# Altium project EVLSERVO1_control_v2.PrjPcb (part 3 of 9)
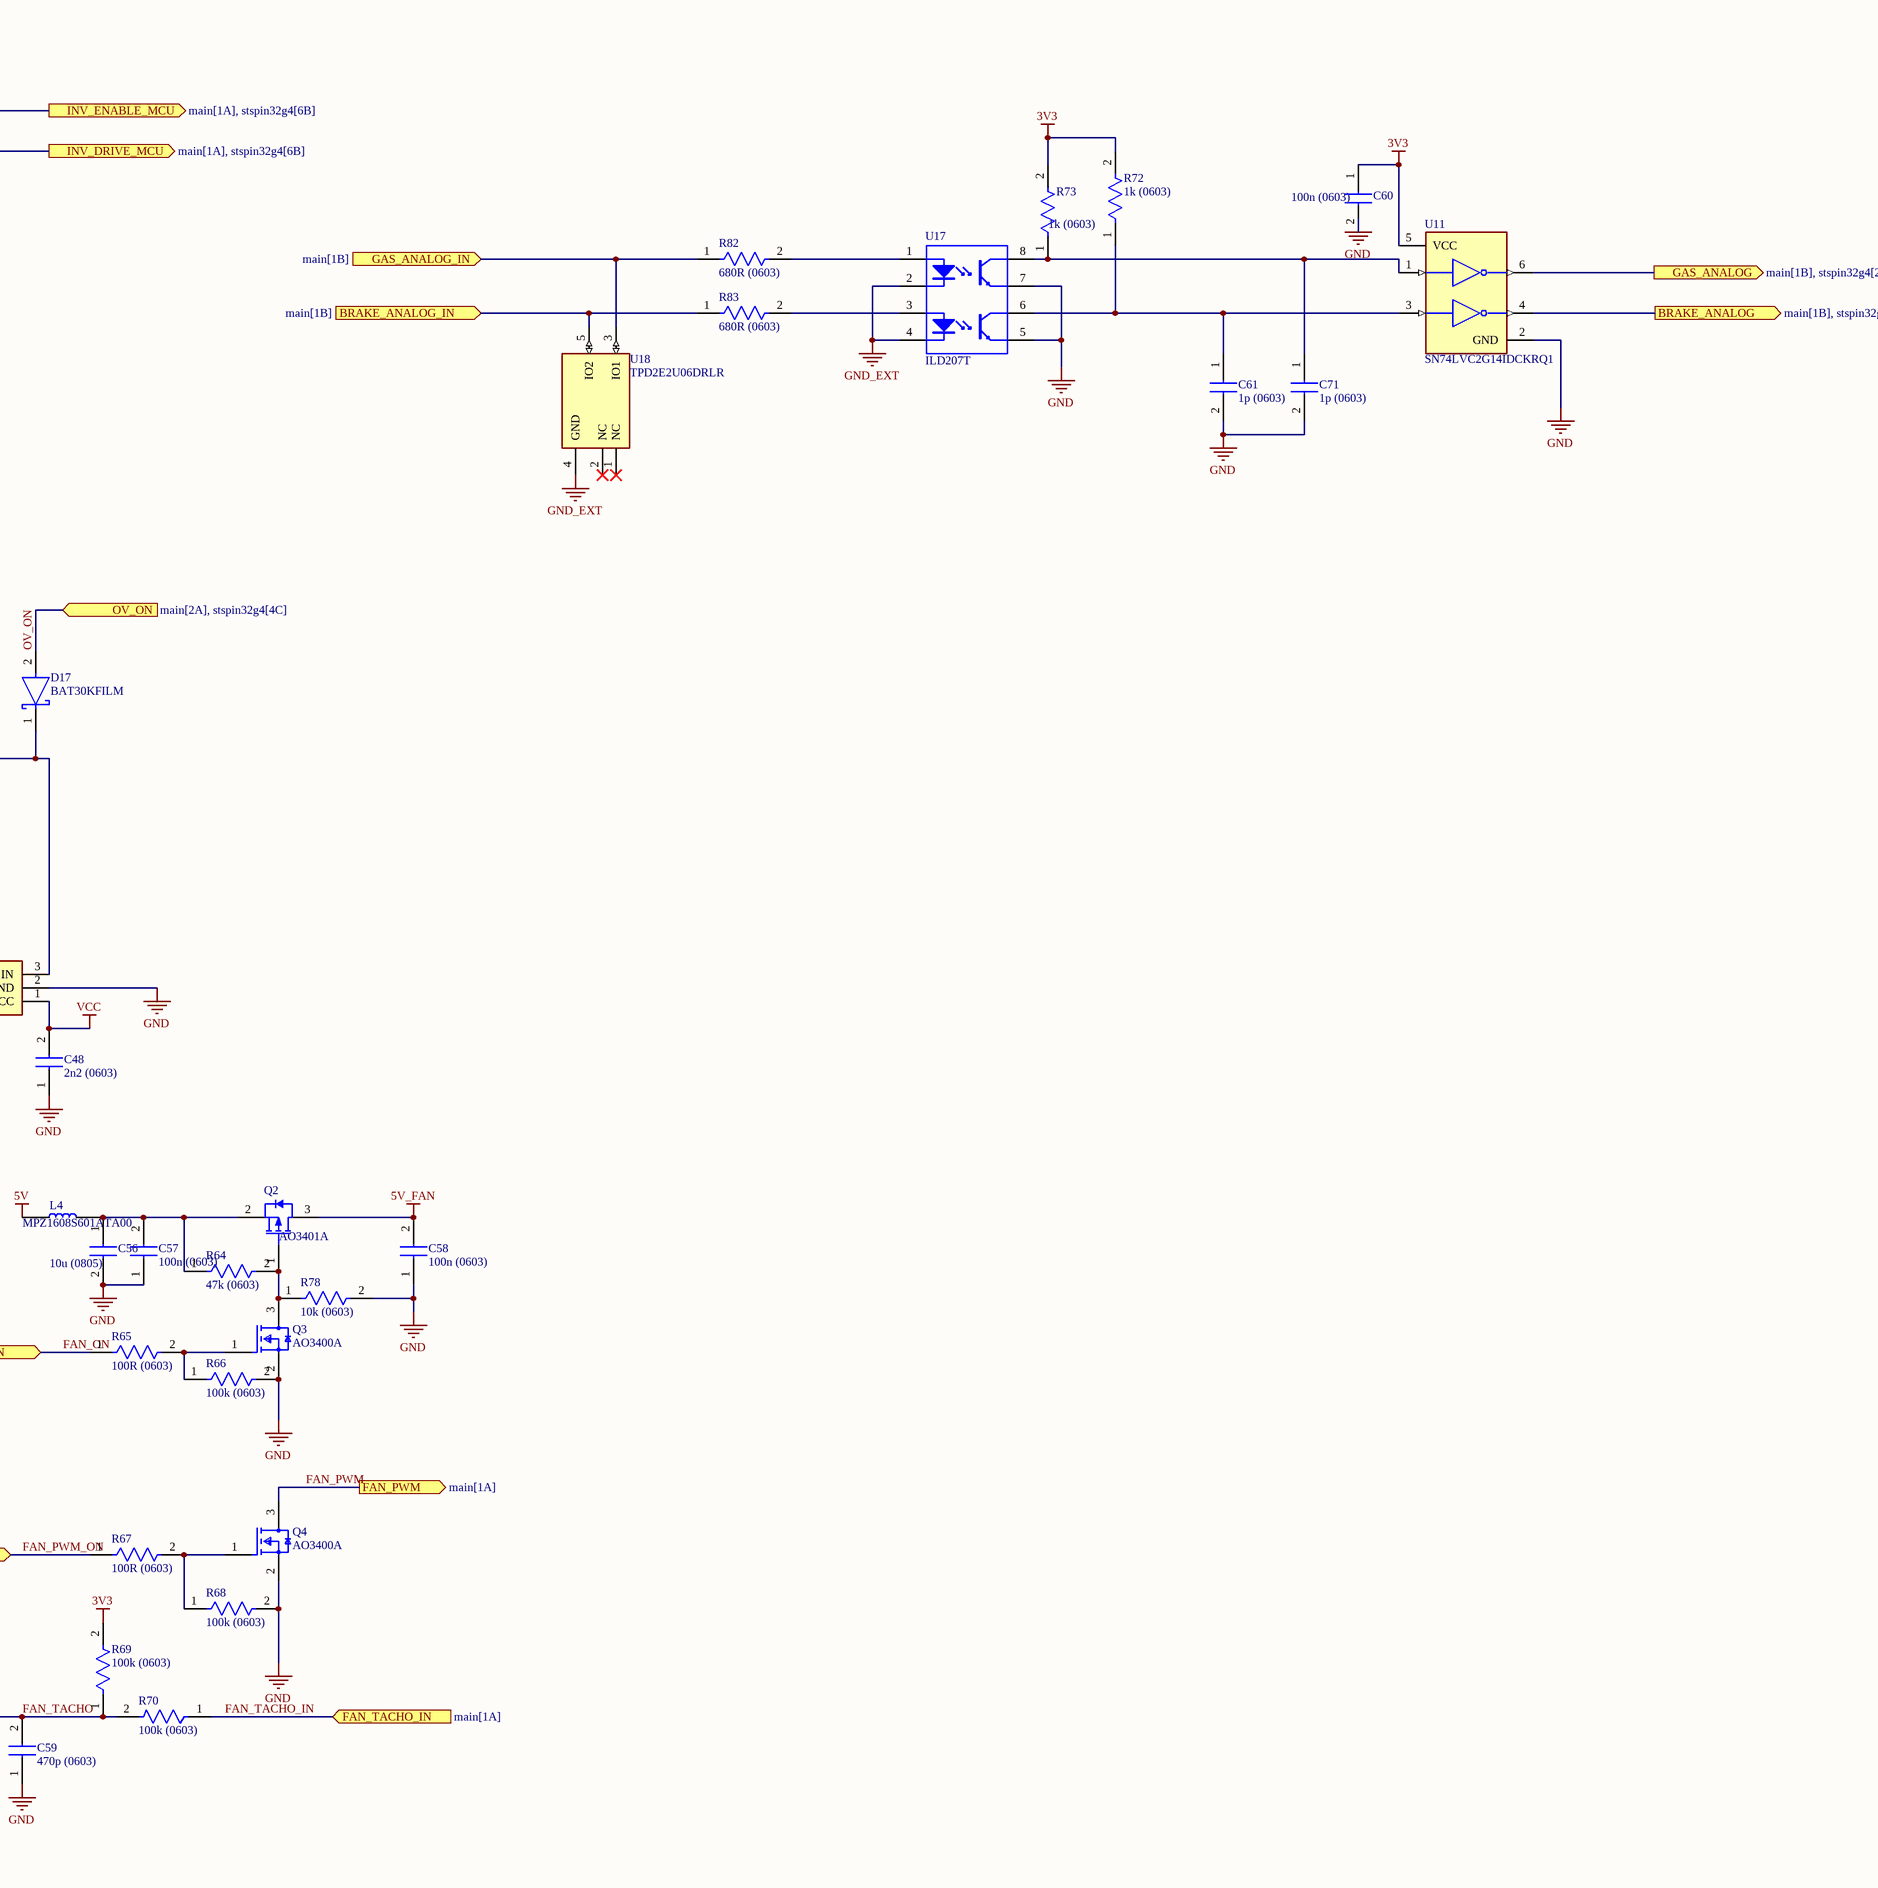
[diagram p6: peripherals.SchDoc, right]

## Sheet peripherals.SchDoc (continued)

### Library data of the parts (continued)
R22 = RK73H1JTTD1200F: Res Thick Film 0603 120 Ohm 1% 0.125W(1/8W) ±100ppm/C Pad SMD T/R Automotive AEC-Q200; Manufacturer_Name: Yageo Group; Manufacturer_Part_Number: SR0603FR-7T10KL; Power Rating: 250mW; Value: 10kΩ; Temperature Coefficient: 100ppm/°C; Voltage Rating: 75V; Working Voltage: 150V; Voltage Rating (DC): 50V; Max Power Dissipation: 125mW; Datasheet Link: https://mouser.componentsearchengine.com/Datasheets/1/SR0603FR-7T10KL.pdf; Height: 0.55mm; Mouser Part Number: 603-SR0603FR-7T10KL; Mouser Price/Stock: https://www.mouser.co.uk/ProductDetail/YAGEO/SR0603FR-7T10KL?qs=pfd5qewlna6IurLw3u3uRA%3D%3D; Arrow Part Number: SR0603FR-7T10KL; Arrow Price/Stock: https://www.arrow.com/en/products/sr0603fr-7t10kl/yageo; Supplier: DigiKey; Supplier Part Number: YAG5823CT-ND; Manufacturer: Yageo Group; Manufacturer Part Number: SR0603FR-7T10KL; RoHS: Compliant; Category: Chip SMD Resistors; Pricing: 1=0,67, 10=0,399, 25=0,3376, 50=0,3022, 100=0,2744, 250=0,24612, 500=0,22976, 1000=0,21675 (USD); Case/Package: 0603; China RoHS: Non-Compliant; Composition: Thick Film; Country of Origin: Mainland China, Taiwan; Export Control Classification Number (ECCN) Code: EAR99; Harmonized Tariff Schedule (HTS) Code: 8533.21.00.30; Introduction Date: 2017-10-02; Length: 1.6mm; Lifecycle Status: Production; Max Operating Temperature: 155°C; Min Operating Temperature: -55°C; Mounting Technology: Surface Mount; Number of Terminals: 2; Packaging: Tape & Reel; Ratings: AEC-Q200; REACH SVHC: Yes; Tolerance: 1%; Width: 800µm; ComponentLink1URL: https://datasheet.octopart.com:443/SR0603FR-7T10KL-Yageo-datasheet-176402240.pdf?src-supplier=Farnell; ComponentLink1Description: https://datasheet.octopart.com:443/SR0603FR-7T10KL-Yageo-datasheet-176402240.pdf?src-supplier=Farnell; ComponentLink2URL: https://datasheet.octopart.com:443/SR0603FR-7T10KL-Yageo-datasheet-119732217.pdf?src-supplier=Upverter; ComponentLink2Description: https://datasheet.octopart.com:443/SR0603FR-7T10KL-Yageo-datasheet-119732217.pdf?src-supplier=Upverter; ComponentLink3URL: https://datasheet.octopart.com:443/SR0603FR-7T10KL-Yageo-Group-datasheet-184785656.pdf?src-supplier=Future+Electronics; ComponentLink3Description: https://datasheet.octopart.com:443/SR0603FR-7T10KL-Yageo-Group-datasheet-184785656.pdf?src-supplier=Future+Electronics; ComponentLink4URL: https://datasheet.octopart.com:443/SR0603FR-7T10KL-Yageo-datasheet-155675517.pdf?src-supplier=Future+Electronics; ComponentLink4Description: https://datasheet.octopart.com:443/SR0603FR-7T10KL-Yageo-datasheet-155675517.pdf?src-supplier=Future+Electronics; ComponentLink5URL: https://datasheet.octopart.com:443/SR0603FR-7T10KL-Yageo-datasheet-137701088.pdf?src-supplier=Future+Electronics; ComponentLink5Description: https://datasheet.octopart.com:443/SR0603FR-7T10KL-Yageo-datasheet-137701088.pdf?src-supplier=Future+Electronics; ComponentLink6URL: https://datasheet.octopart.com/SR0603FR-7T10KL-Yageo-datasheet-11047080.pdf; ComponentLink6Description: https://datasheet.octopart.com/SR0603FR-7T10KL-Yageo-datasheet-11047080.pdf; ComponentLink7URL: http://sigma.octopart.com:80/conflict_mineral_statement/Yageo-company-3.pdf?src-supplier=Compliance+Statements; ComponentLink7Description: http://sigma.octopart.com:80/conflict_mineral_statement/Yageo-company-3.pdf?src-supplier=Compliance+Statements; ComponentLink8URL: http://sigma.octopart.com:80/rohs_statement/Yageo-company-2.pdf?src-supplier=Compliance+Statements; ComponentLink8Description: http://sigma.octopart.com:80/rohs_statement/Yageo-company-2.pdf?src-supplier=Compliance+Statements; Stock: 5000; ComponentLink9URL: https://datasheet.octopart.com:443/SR0603FR-7T4R7L-Yageo-datasheet-176402240.pdf?src-supplier=Farnell; ComponentLink9Description: https://datasheet.octopart.com:443/SR0603FR-7T4R7L-Yageo-datasheet-176402240.pdf?src-supplier=Farnell; ComponentLink10URL: https://datasheet.octopart.com:443/SR0603FR-7T4R7L-Yageo-datasheet-119732217.pdf?src-supplier=Upverter; ComponentLink10Description: https://datasheet.octopart.com:443/SR0603FR-7T4R7L-Yageo-datasheet-119732217.pdf?src-supplier=Upverter; ComponentLink11URL: https://datasheet.octopart.com:443/SR0603FR-7T4R7L-Yageo-Group-datasheet-184785656.pdf?src-supplier=Future+Electronics; ComponentLink11Description: https://datasheet.octopart.com:443/SR0603FR-7T4R7L-Yageo-Group-datasheet-184785656.pdf?src-supplier=Future+Electronics; ComponentLink12URL: https://datasheet.octopart.com:443/SR0603FR-7T4R7L-Yageo-datasheet-155675517.pdf?src-supplier=Future+Electronics; ComponentLink12Description: https://datasheet.octopart.com:443/SR0603FR-7T4R7L-Yageo-datasheet-155675517.pdf?src-supplier=Future+Electronics; ComponentLink13URL: https://datasheet.octopart.com:443/SR0603FR-7T4R7L-Yageo-datasheet-137701088.pdf?src-supplier=Future+Electronics; ComponentLink13Description: https://datasheet.octopart.com:443/SR0603FR-7T4R7L-Yageo-datasheet-137701088.pdf?src-supplier=Future+Electronics; ComponentLink14URL: https://datasheet.octopart.com/SR0603FR-7T4R7L-Yageo-datasheet-11047080.pdf; ComponentLink14Description: https://datasheet.octopart.com/SR0603FR-7T4R7L-Yageo-datasheet-11047080.pdf; Max Voltage Rating (DC): 150V; ComponentLink15URL: https://datasheet.octopart.com:443/SG73G1JTTD5102C-KOA-Speer-datasheet-181956059.pdf?src-supplier=IHS; ComponentLink15Description: https://datasheet.octopart.com:443/SG73G1JTTD5102C-KOA-Speer-datasheet-181956059.pdf?src-supplier=IHS; ComponentLink16URL: https://sigma.octopart.com:443/141350679/technical_drawing/KOA-Speer-SG73G1JTTD5102C.pdf?src-supplier=KOA+Speer+SCT; ComponentLink16Description: https://sigma.octopart.com:443/141350679/technical_drawing/KOA-Speer-SG73G1JTTD5102C.pdf?src-supplier=KOA+Speer+SCT; ComponentLink17URL: https://datasheet.octopart.com:443/SG73G1JTTD5102C-KOA-Speer-datasheet-141350755.pdf?src-supplier=KOA+Speer+SCT; ComponentLink17Description: https://datasheet.octopart.com:443/SG73G1JTTD5102C-KOA-Speer-datasheet-141350755.pdf?src-supplier=KOA+Speer+SCT; ComponentLink18URL: http://sigma.octopart.com:80/rohs_statement/KOA-Speer-company-17.pdf?src-supplier=Compliance+Statements; ComponentLink18Description: http://sigma.octopart.com:80/rohs_statement/KOA-Speer-company-17.pdf?src-supplier=Compliance+Statements; ComponentLink19URL: https://datasheet.octopart.com:443/ESR03EZPD5102-ROHM-datasheet-182147624.pdf?src-supplier=IHS; ComponentLink19Description: https://datasheet.octopart.com:443/ESR03EZPD5102-ROHM-datasheet-182147624.pdf?src-supplier=IHS; Case Code (Imperial): 0603; Case Code (Metric): 1608; Depth: 800µm; Lead Free: Lead Free; Military Standard: Not; Schedule B: 8533210045, 8533210045|8533210045, 8533210045|8533210045|8533210045, 8533210045|8533210045|8533210045|8533210045; Termination: SMD/SMT; ComponentLink20URL: https://datasheet.octopart.com:443/RK73H1JTTD68R0F-KOA-Speer-datasheet-181956035.pdf?src-supplier=IHS; ComponentLink20Description: https://datasheet.octopart.com:443/RK73H1JTTD68R0F-KOA-Speer-datasheet-181956035.pdf?src-supplier=IHS; ComponentLink21URL: https://datasheet.octopart.com:443/RK73H1JTTD68R0F-KOA-Speer-datasheet-11590619.pdf?src-supplier=Upverter; ComponentLink21Description: https://datasheet.octopart.com:443/RK73H1JTTD68R0F-KOA-Speer-datasheet-11590619.pdf?src-supplier=Upverter; ComponentLink22URL: https://datasheet.octopart.com:443/RK73H1JTTD68R0F-KOA-Speer-datasheet-149653815.pdf?src-supplier=Newark; ComponentLink22Description: https://datasheet.octopart.com:443/RK73H1JTTD68R0F-KOA-Speer-datasheet-149653815.pdf?src-supplier=Newark; ComponentLink23URL: https://datasheet.octopart.com:443/RK73H1JTTD68R0F-KOA-Speer-datasheet-10854116.pdf?src-supplier=element14+APAC; ComponentLink23Description: https://datasheet.octopart.com:443/RK73H1JTTD68R0F-KOA-Speer-datasheet-10854116.pdf?src-supplier=element14+APAC; Contact Plating: Tin; Features: Anti-Sulfur, Moisture Resistant; Number of Terminations: 2; Radiation Hardening: No; ComponentLink24URL: https://datasheet.octopart.com:443/RNCP0603FTD10K0-Stackpole-Electronics-datasheet-182148179.pdf?src-supplier=IHS; ComponentLink24Description: https://datasheet.octopart.com:443/RNCP0603FTD10K0-Stackpole-Electronics-datasheet-182148179.pdf?src-supplier=IHS; ComponentLink25URL: https://datasheet.octopart.com:443/RNCP0603FTD10K0-Stackpole-Electronics-datasheet-141193801.pdf?src-supplier=Upverter; ComponentLink25Description: https://datasheet.octopart.com:443/RNCP0603FTD10K0-Stackpole-Electronics-datasheet-141193801.pdf?src-supplier=Upverter; ComponentLink26URL: https://datasheet.octopart.com:443/RNCP0603FTD10K0-Stackpole-Electronics-datasheet-38896780.pdf?src-supplier=Upverter; ComponentLink26Description: https://datasheet.octopart.com:443/RNCP0603FTD10K0-Stackpole-Electronics-datasheet-38896780.pdf?src-supplier=Upverter; ComponentLink27URL: https://datasheet.octopart.com:443/RNCP0603FTD10K0-Stackpole-Electronics-datasheet-149178200.pdf?src-supplier=Upverter; ComponentLink27Description: https://datasheet.octopart.com:443/RNCP0603FTD10K0-Stackpole-Electronics-datasheet-149178200.pdf?src-supplier=Upverter; ComponentLink28URL: https://datasheet.octopart.com:443/RNCP0603FTD10K0-Stackpole-Electronics-datasheet-33021030.pdf?src-supplier=Future+Electronics; ComponentLink28Description: https://datasheet.octopart.com:443/RNCP0603FTD10K0-Stackpole-Electronics-datasheet-33021030.pdf?src-supplier=Future+Electronics; ComponentLink29URL: http://sigma.octopart.com:80/15942470/materials_sheet/Stackpole-Electronics-RNCP0603FTD10K0.pdf?src-supplier=Compliance+Statements; ComponentLink29Description: http://sigma.octopart.com:80/15942470/materials_sheet/Stackpole-Electronics-RNCP0603FTD10K0.pdf?src-supplier=Compliance+Statements; ComponentLink30URL: http://sigma.octopart.com:80/141158212/rohs_statement/Stackpole-Electronics-RNCP0603FTD10K0.pdf?src-supplier=Compliance+Statements; ComponentLink30Description: http://sigma.octopart.com:80/141158212/rohs_statement/Stackpole-Electronics-RNCP0603FTD10K0.pdf?src-supplier=Compliance+Statements; ComponentLink31URL: http://sigma.octopart.com:80/141158211/reach_statement/Stackpole-Electronics-RNCP0603FTD10K0.pdf?src-supplier=Compliance+Statements; ComponentLink31Description: http://sigma.octopart.com:80/141158211/reach_statement/Stackpole-Electronics-RNCP0603FTD10K0.pdf?src-supplier=Compliance+Statements; Pins: 2; ComponentLink32URL: https://datasheet.octopart.com:443/RK73H1JTTD1200F-KOA-Speer-datasheet-181956035.pdf?src-supplier=IHS; ComponentLink32Description: https://datasheet.octopart.com:443/RK73H1JTTD1200F-KOA-Speer-datasheet-181956035.pdf?src-supplier=IHS; ComponentLink33URL: https://datasheet.octopart.com:443/RK73H1JTTD1200F-KOA-Speer-datasheet-11590619.pdf?src-supplier=Upverter; ComponentLink33Description: https://datasheet.octopart.com:443/RK73H1JTTD1200F-KOA-Speer-datasheet-11590619.pdf?src-supplier=Upverter; ComponentLink34URL: https://datasheet.octopart.com:443/RK73H1JTTD1200F-KOA-Speer-datasheet-149653815.pdf?src-supplier=Farnell; ComponentLink34Description: https://datasheet.octopart.com:443/RK73H1JTTD1200F-KOA-Speer-datasheet-149653815.pdf?src-supplier=Farnell; ComponentLink35URL: https://datasheet.octopart.com:443/RK73H1JTTD1200F-KOA-Speer-datasheet-188906116.pdf?src-supplier=TME; ComponentLink35Description: https://datasheet.octopart.com:443/RK73H1JTTD1200F-KOA-Speer-datasheet-188906116.pdf?src-supplier=TME; ComponentLink36URL: https://datasheet.octopart.com/RK73H-%7C-Flat-Chip-Resistors-%28Precision-Grade%29-KOA-Speer-datasheet-family-85.pdf; ComponentLink36Description: https://datasheet.octopart.com/RK73H-%7C-Flat-Chip-Resistors-%28Precision-Grade%29-KOA-Speer-datasheet-family-85.pdf; ComponentLink37URL: https://datasheet.octopart.com:443/RK73H1JTTD1200F-KOA-Speer-datasheet-10854116.pdf?src-supplier=element14+APAC; ComponentLink37Description: https://datasheet.octopart.com:443/RK73H1JTTD1200F-KOA-Speer-datasheet-10854116.pdf?src-supplier=element14+APAC; ComponentLink38URL: http://sigma.octopart.com:80/rohs_certificate/RK73H-%7C-Flat-Chip-Resistors-%28Precision-Grade%29-KOA-Speer-family-91.pdf?src-supplier=Compliance+Statements; ComponentLink38Description: http://sigma.octopart.com:80/rohs_certificate/RK73H-%7C-Flat-Chip-Resistors-%28Precision-Grade%29-KOA-Speer-family-91.pdf?src-supplier=Compliance+Statements
R23 R25-R27 R35 = RK73H1JTTD68R0F: Res Thick Film 0603 68 Ohm 1% 0.125W(1/8W) ±100ppm/C Pad SMD Automotive T/R; Manufacturer_Name: Yageo Group; Manufacturer_Part_Number: SR0603FR-7T10KL; Power Rating: 250mW; Value: 10kΩ; Temperature Coefficient: 100ppm/°C; Voltage Rating: 75V; Working Voltage: 150V; Voltage Rating (DC): 50V; Datasheet Link: https://mouser.componentsearchengine.com/Datasheets/1/SR0603FR-7T10KL.pdf; Height: 0.55mm; Mouser Part Number: 603-SR0603FR-7T10KL; Mouser Price/Stock: https://www.mouser.co.uk/ProductDetail/YAGEO/SR0603FR-7T10KL?qs=pfd5qewlna6IurLw3u3uRA%3D%3D; Arrow Part Number: SR0603FR-7T10KL; Arrow Price/Stock: https://www.arrow.com/en/products/sr0603fr-7t10kl/yageo; Supplier: DigiKey; Supplier Part Number: YAG5823CT-ND; Manufacturer: Yageo Group; Manufacturer Part Number: SR0603FR-7T10KL; RoHS: Compliant; Category: Chip SMD Resistors; Pricing: 1=0,67, 10=0,399, 25=0,3376, 50=0,3022, 100=0,2744, 250=0,24612, 500=0,22976, 1000=0,21675 (USD); Case/Package: 0603; China RoHS: Non-Compliant; Composition: Thick Film; Country of Origin: Mainland China, Taiwan; Export Control Classification Number (ECCN) Code: EAR99; Harmonized Tariff Schedule (HTS) Code: 8533.21.00.30; Introduction Date: 2017-10-02; Length: 1.6mm; Lifecycle Status: Production; Max Operating Temperature: 155°C; Min Operating Temperature: -55°C; Mounting Technology: Surface Mount; Number of Terminals: 2; Packaging: Tape & Reel; Ratings: AEC-Q200; REACH SVHC: Yes; Tolerance: 1%; Width: 800µm; ComponentLink1URL: https://datasheet.octopart.com:443/SR0603FR-7T10KL-Yageo-datasheet-176402240.pdf?src-supplier=Farnell; ComponentLink1Description: https://datasheet.octopart.com:443/SR0603FR-7T10KL-Yageo-datasheet-176402240.pdf?src-supplier=Farnell; ComponentLink2URL: https://datasheet.octopart.com:443/SR0603FR-7T10KL-Yageo-datasheet-119732217.pdf?src-supplier=Upverter; ComponentLink2Description: https://datasheet.octopart.com:443/SR0603FR-7T10KL-Yageo-datasheet-119732217.pdf?src-supplier=Upverter; ComponentLink3URL: https://datasheet.octopart.com:443/SR0603FR-7T10KL-Yageo-Group-datasheet-184785656.pdf?src-supplier=Future+Electronics; ComponentLink3Description: https://datasheet.octopart.com:443/SR0603FR-7T10KL-Yageo-Group-datasheet-184785656.pdf?src-supplier=Future+Electronics; ComponentLink4URL: https://datasheet.octopart.com:443/SR0603FR-7T10KL-Yageo-datasheet-155675517.pdf?src-supplier=Future+Electronics; ComponentLink4Description: https://datasheet.octopart.com:443/SR0603FR-7T10KL-Yageo-datasheet-155675517.pdf?src-supplier=Future+Electronics; ComponentLink5URL: https://datasheet.octopart.com:443/SR0603FR-7T10KL-Yageo-datasheet-137701088.pdf?src-supplier=Future+Electronics; ComponentLink5Description: https://datasheet.octopart.com:443/SR0603FR-7T10KL-Yageo-datasheet-137701088.pdf?src-supplier=Future+Electronics; ComponentLink6URL: https://datasheet.octopart.com/SR0603FR-7T10KL-Yageo-datasheet-11047080.pdf; ComponentLink6Description: https://datasheet.octopart.com/SR0603FR-7T10KL-Yageo-datasheet-11047080.pdf; ComponentLink7URL: http://sigma.octopart.com:80/conflict_mineral_statement/Yageo-company-3.pdf?src-supplier=Compliance+Statements; ComponentLink7Description: http://sigma.octopart.com:80/conflict_mineral_statement/Yageo-company-3.pdf?src-supplier=Compliance+Statements; ComponentLink8URL: http://sigma.octopart.com:80/rohs_statement/Yageo-company-2.pdf?src-supplier=Compliance+Statements; ComponentLink8Description: http://sigma.octopart.com:80/rohs_statement/Yageo-company-2.pdf?src-supplier=Compliance+Statements; Stock: 5000; ComponentLink9URL: https://datasheet.octopart.com:443/SR0603FR-7T4R7L-Yageo-datasheet-176402240.pdf?src-supplier=Farnell; ComponentLink9Description: https://datasheet.octopart.com:443/SR0603FR-7T4R7L-Yageo-datasheet-176402240.pdf?src-supplier=Farnell; ComponentLink10URL: https://datasheet.octopart.com:443/SR0603FR-7T4R7L-Yageo-datasheet-119732217.pdf?src-supplier=Upverter; ComponentLink10Description: https://datasheet.octopart.com:443/SR0603FR-7T4R7L-Yageo-datasheet-119732217.pdf?src-supplier=Upverter; ComponentLink11URL: https://datasheet.octopart.com:443/SR0603FR-7T4R7L-Yageo-Group-datasheet-184785656.pdf?src-supplier=Future+Electronics; ComponentLink11Description: https://datasheet.octopart.com:443/SR0603FR-7T4R7L-Yageo-Group-datasheet-184785656.pdf?src-supplier=Future+Electronics; ComponentLink12URL: https://datasheet.octopart.com:443/SR0603FR-7T4R7L-Yageo-datasheet-155675517.pdf?src-supplier=Future+Electronics; ComponentLink12Description: https://datasheet.octopart.com:443/SR0603FR-7T4R7L-Yageo-datasheet-155675517.pdf?src-supplier=Future+Electronics; ComponentLink13URL: https://datasheet.octopart.com:443/SR0603FR-7T4R7L-Yageo-datasheet-137701088.pdf?src-supplier=Future+Electronics; ComponentLink13Description: https://datasheet.octopart.com:443/SR0603FR-7T4R7L-Yageo-datasheet-137701088.pdf?src-supplier=Future+Electronics; ComponentLink14URL: https://datasheet.octopart.com/SR0603FR-7T4R7L-Yageo-datasheet-11047080.pdf; ComponentLink14Description: https://datasheet.octopart.com/SR0603FR-7T4R7L-Yageo-datasheet-11047080.pdf; Max Voltage Rating (DC): 150V; ComponentLink15URL: https://datasheet.octopart.com:443/SG73G1JTTD5102C-KOA-Speer-datasheet-181956059.pdf?src-supplier=IHS; ComponentLink15Description: https://datasheet.octopart.com:443/SG73G1JTTD5102C-KOA-Speer-datasheet-181956059.pdf?src-supplier=IHS; ComponentLink16URL: https://sigma.octopart.com:443/141350679/technical_drawing/KOA-Speer-SG73G1JTTD5102C.pdf?src-supplier=KOA+Speer+SCT; ComponentLink16Description: https://sigma.octopart.com:443/141350679/technical_drawing/KOA-Speer-SG73G1JTTD5102C.pdf?src-supplier=KOA+Speer+SCT; ComponentLink17URL: https://datasheet.octopart.com:443/SG73G1JTTD5102C-KOA-Speer-datasheet-141350755.pdf?src-supplier=KOA+Speer+SCT; ComponentLink17Description: https://datasheet.octopart.com:443/SG73G1JTTD5102C-KOA-Speer-datasheet-141350755.pdf?src-supplier=KOA+Speer+SCT; ComponentLink18URL: http://sigma.octopart.com:80/rohs_statement/KOA-Speer-company-17.pdf?src-supplier=Compliance+Statements; ComponentLink18Description: http://sigma.octopart.com:80/rohs_statement/KOA-Speer-company-17.pdf?src-supplier=Compliance+Statements; ComponentLink19URL: https://datasheet.octopart.com:443/ESR03EZPD5102-ROHM-datasheet-182147624.pdf?src-supplier=IHS; ComponentLink19Description: https://datasheet.octopart.com:443/ESR03EZPD5102-ROHM-datasheet-182147624.pdf?src-supplier=IHS; Case Code (Imperial): 0603; Case Code (Metric): 1608; Depth: 800µm; Lead Free: Lead Free; Military Standard: Not; Schedule B: 8533210045, 8533210045|8533210045, 8533210045|8533210045|8533210045, 8533210045|8533210045|8533210045|8533210045; Termination: SMD/SMT; ComponentLink20URL: https://datasheet.octopart.com:443/RK73H1JTTD68R0F-KOA-Speer-datasheet-181956035.pdf?src-supplier=IHS; ComponentLink20Description: https://datasheet.octopart.com:443/RK73H1JTTD68R0F-KOA-Speer-datasheet-181956035.pdf?src-supplier=IHS; ComponentLink21URL: https://datasheet.octopart.com:443/RK73H1JTTD68R0F-KOA-Speer-datasheet-11590619.pdf?src-supplier=Upverter; ComponentLink21Description: https://datasheet.octopart.com:443/RK73H1JTTD68R0F-KOA-Speer-datasheet-11590619.pdf?src-supplier=Upverter; ComponentLink22URL: https://datasheet.octopart.com:443/RK73H1JTTD68R0F-KOA-Speer-datasheet-149653815.pdf?src-supplier=Newark; ComponentLink22Description: https://datasheet.octopart.com:443/RK73H1JTTD68R0F-KOA-Speer-datasheet-149653815.pdf?src-supplier=Newark; ComponentLink23URL: https://datasheet.octopart.com:443/RK73H1JTTD68R0F-KOA-Speer-datasheet-10854116.pdf?src-supplier=element14+APAC; ComponentLink23Description: https://datasheet.octopart.com:443/RK73H1JTTD68R0F-KOA-Speer-datasheet-10854116.pdf?src-supplier=element14+APAC
R28-R30 R55-R57 R60 R62-R70 R78 = AC0603FR-7W2KL: Fixed Resistor, Metal Glaze/Thick Film, 0.2W, 2000ohm, 75V, 1% +/-Tol, Surface Mount, 0603; Manufacturer_Name: Yageo Group; Manufacturer_Part_Number: SR0603FR-7T10KL; Power Rating: 250mW; Value: 10kΩ; Temperature Coefficient: 100ppm/°C; Working Voltage: 150V; Max Voltage Rating (DC): 100V; Datasheet Link: https://mouser.componentsearchengine.com/Datasheets/1/SR0603FR-7T10KL.pdf; Height: 0.55mm; Mouser Part Number: 603-SR0603FR-7T10KL; Mouser Price/Stock: https://www.mouser.co.uk/ProductDetail/YAGEO/SR0603FR-7T10KL?qs=pfd5qewlna6IurLw3u3uRA%3D%3D; Arrow Part Number: SR0603FR-7T10KL; Arrow Price/Stock: https://www.arrow.com/en/products/sr0603fr-7t10kl/yageo; Supplier: DigiKey; Supplier Part Number: YAG5823CT-ND; Manufacturer: Yageo Group; Manufacturer Part Number: SR0603FR-7T10KL; RoHS: Compliant; Category: Chip SMD Resistors; Pricing: 1=0,67, 10=0,399, 25=0,3376, 50=0,3022, 100=0,2744, 250=0,24612, 500=0,22976, 1000=0,21675 (USD); Case/Package: 0603; China RoHS: Non-Compliant; Composition: Thick Film; Country of Origin: Mainland China, Taiwan; Export Control Classification Number (ECCN) Code: EAR99; Harmonized Tariff Schedule (HTS) Code: 8533.21.00.30; Introduction Date: 2017-10-02; Length: 1.6mm; Lifecycle Status: Production; Max Operating Temperature: 155°C; Min Operating Temperature: -55°C; Mounting Technology: Surface Mount; Number of Terminals: 2; Packaging: Tape & Reel; Ratings: AEC-Q200; REACH SVHC: Yes; Tolerance: 1%; Voltage Rating: 75V; Width: 800µm; ComponentLink1URL: https://datasheet.octopart.com:443/SR0603FR-7T10KL-Yageo-datasheet-176402240.pdf?src-supplier=Farnell; ComponentLink1Description: https://datasheet.octopart.com:443/SR0603FR-7T10KL-Yageo-datasheet-176402240.pdf?src-supplier=Farnell; ComponentLink2URL: https://datasheet.octopart.com:443/SR0603FR-7T10KL-Yageo-datasheet-119732217.pdf?src-supplier=Upverter; ComponentLink2Description: https://datasheet.octopart.com:443/SR0603FR-7T10KL-Yageo-datasheet-119732217.pdf?src-supplier=Upverter; ComponentLink3URL: https://datasheet.octopart.com:443/SR0603FR-7T10KL-Yageo-Group-datasheet-184785656.pdf?src-supplier=Future+Electronics; ComponentLink3Description: https://datasheet.octopart.com:443/SR0603FR-7T10KL-Yageo-Group-datasheet-184785656.pdf?src-supplier=Future+Electronics; ComponentLink4URL: https://datasheet.octopart.com:443/SR0603FR-7T10KL-Yageo-datasheet-155675517.pdf?src-supplier=Future+Electronics; ComponentLink4Description: https://datasheet.octopart.com:443/SR0603FR-7T10KL-Yageo-datasheet-155675517.pdf?src-supplier=Future+Electronics; ComponentLink5URL: https://datasheet.octopart.com:443/SR0603FR-7T10KL-Yageo-datasheet-137701088.pdf?src-supplier=Future+Electronics; ComponentLink5Description: https://datasheet.octopart.com:443/SR0603FR-7T10KL-Yageo-datasheet-137701088.pdf?src-supplier=Future+Electronics; ComponentLink6URL: https://datasheet.octopart.com/SR0603FR-7T10KL-Yageo-datasheet-11047080.pdf; ComponentLink6Description: https://datasheet.octopart.com/SR0603FR-7T10KL-Yageo-datasheet-11047080.pdf; ComponentLink7URL: http://sigma.octopart.com:80/conflict_mineral_statement/Yageo-company-3.pdf?src-supplier=Compliance+Statements; ComponentLink7Description: http://sigma.octopart.com:80/conflict_mineral_statement/Yageo-company-3.pdf?src-supplier=Compliance+Statements; ComponentLink8URL: http://sigma.octopart.com:80/rohs_statement/Yageo-company-2.pdf?src-supplier=Compliance+Statements; ComponentLink8Description: http://sigma.octopart.com:80/rohs_statement/Yageo-company-2.pdf?src-supplier=Compliance+Statements; Stock: 5000; ComponentLink9URL: https://datasheet.octopart.com:443/SR0603FR-7T4R7L-Yageo-datasheet-176402240.pdf?src-supplier=Farnell; ComponentLink9Description: https://datasheet.octopart.com:443/SR0603FR-7T4R7L-Yageo-datasheet-176402240.pdf?src-supplier=Farnell; ComponentLink10URL: https://datasheet.octopart.com:443/SR0603FR-7T4R7L-Yageo-datasheet-119732217.pdf?src-supplier=Upverter; ComponentLink10Description: https://datasheet.octopart.com:443/SR0603FR-7T4R7L-Yageo-datasheet-119732217.pdf?src-supplier=Upverter; ComponentLink11URL: https://datasheet.octopart.com:443/SR0603FR-7T4R7L-Yageo-Group-datasheet-184785656.pdf?src-supplier=Future+Electronics; ComponentLink11Description: https://datasheet.octopart.com:443/SR0603FR-7T4R7L-Yageo-Group-datasheet-184785656.pdf?src-supplier=Future+Electronics; ComponentLink12URL: https://datasheet.octopart.com:443/SR0603FR-7T4R7L-Yageo-datasheet-155675517.pdf?src-supplier=Future+Electronics; ComponentLink12Description: https://datasheet.octopart.com:443/SR0603FR-7T4R7L-Yageo-datasheet-155675517.pdf?src-supplier=Future+Electronics; ComponentLink13URL: https://datasheet.octopart.com:443/SR0603FR-7T4R7L-Yageo-datasheet-137701088.pdf?src-supplier=Future+Electronics; ComponentLink13Description: https://datasheet.octopart.com:443/SR0603FR-7T4R7L-Yageo-datasheet-137701088.pdf?src-supplier=Future+Electronics; ComponentLink14URL: https://datasheet.octopart.com/SR0603FR-7T4R7L-Yageo-datasheet-11047080.pdf; ComponentLink14Description: https://datasheet.octopart.com/SR0603FR-7T4R7L-Yageo-datasheet-11047080.pdf; Schedule B: 8533210045, 8533210045|8533210045|8533210045|8533210045|8533210045; ComponentLink15URL: https://datasheet.octopart.com:443/SR0603FR-7T100KL-Yageo-datasheet-176402240.pdf?src-supplier=element14+APAC; ComponentLink15Description: https://datasheet.octopart.com:443/SR0603FR-7T100KL-Yageo-datasheet-176402240.pdf?src-supplier=element14+APAC; ComponentLink16URL: https://datasheet.octopart.com:443/SR0603FR-7T100KL-Yageo-datasheet-119732217.pdf?src-supplier=Upverter; ComponentLink16Description: https://datasheet.octopart.com:443/SR0603FR-7T100KL-Yageo-datasheet-119732217.pdf?src-supplier=Upverter; ComponentLink17URL: https://datasheet.octopart.com:443/SR0603FR-7T100KL-Yageo-Group-datasheet-184785656.pdf?src-supplier=Future+Electronics; ComponentLink17Description: https://datasheet.octopart.com:443/SR0603FR-7T100KL-Yageo-Group-datasheet-184785656.pdf?src-supplier=Future+Electronics; ComponentLink18URL: https://datasheet.octopart.com:443/SR0603FR-7T100KL-Yageo-datasheet-155675517.pdf?src-supplier=Future+Electronics; ComponentLink18Description: https://datasheet.octopart.com:443/SR0603FR-7T100KL-Yageo-datasheet-155675517.pdf?src-supplier=Future+Electronics; ComponentLink19URL: https://datasheet.octopart.com:443/SR0603FR-7T100KL-Yageo-datasheet-137701088.pdf?src-supplier=Future+Electronics; ComponentLink19Description: https://datasheet.octopart.com:443/SR0603FR-7T100KL-Yageo-datasheet-137701088.pdf?src-supplier=Future+Electronics; ComponentLink20URL: https://datasheet.octopart.com/SR0603FR-7T100KL-Yageo-datasheet-11047080.pdf; ComponentLink20Description: https://datasheet.octopart.com/SR0603FR-7T100KL-Yageo-datasheet-11047080.pdf; ComponentLink21URL: https://datasheet.octopart.com:443/RS73F1JTTD2001B-KOA-Speer-datasheet-182143723.pdf?src-supplier=IHS; ComponentLink21Description: https://datasheet.octopart.com:443/RS73F1JTTD2001B-KOA-Speer-datasheet-182143723.pdf?src-supplier=IHS; ComponentLink22URL: https://datasheet.octopart.com:443/RS73F1JTTD2001B-KOA-Speer-datasheet-141350738.pdf?src-supplier=KOA+Speer+SCT; ComponentLink22Description: https://datasheet.octopart.com:443/RS73F1JTTD2001B-KOA-Speer-datasheet-141350738.pdf?src-supplier=KOA+Speer+SCT; ComponentLink23URL: https://sigma.octopart.com:443/141350679/technical_drawing/KOA-Speer-RS73F1JTTD2001B.pdf?src-supplier=KOA+Speer+SCT; ComponentLink23Description: https://sigma.octopart.com:443/141350679/technical_drawing/KOA-Speer-RS73F1JTTD2001B.pdf?src-supplier=KOA+Speer+SCT; ComponentLink24URL: http://sigma.octopart.com:80/rohs_statement/KOA-Speer-company-17.pdf?src-supplier=Compliance+Statements; ComponentLink24Description: http://sigma.octopart.com:80/rohs_statement/KOA-Speer-company-17.pdf?src-supplier=Compliance+Statements; ComponentLink25URL: https://datasheet.octopart.com:443/AC0603FR-7W2KL-Yageo-datasheet-182189377.pdf?src-supplier=IHS; ComponentLink25Description: https://datasheet.octopart.com:443/AC0603FR-7W2KL-Yageo-datasheet-182189377.pdf?src-supplier=IHS; ComponentLink26URL: https://datasheet.octopart.com:443/AC0603FR-7W2KL-Yageo-datasheet-86786639.pdf?src-supplier=Upverter; ComponentLink26Description: https://datasheet.octopart.com:443/AC0603FR-7W2KL-Yageo-datasheet-86786639.pdf?src-supplier=Upverter; ComponentLink27URL: https://datasheet.octopart.com/AC0603FR-7W2KL-Yageo-datasheet-12512238.pdf; ComponentLink27Description: https://datasheet.octopart.com/AC0603FR-7W2KL-Yageo-datasheet-12512238.pdf; ClassName: gate_driver
R33 R34 R58 R59 = RQ73C2A75KBTD: Fixed Resistor, Thin Film, 0.2W, 75000ohm, 100V, 0.1% +/-Tol, 10ppm/Cel, Surface Mount, 0805; Manufacturer Part Number: SR0805FR-7W4R7L; Manufacturer: Yageo; Manufacturer Lifecycle Status: ACTIVE; Automotive Grade: Grade 0; Resistance: 4.7Ω; Tolerance: 0.01; Voltage Rating: 150V; Value: 4.7Ω; Power Rating: 0.25W; Temperature Coefficient: 10ppm/°C; Temperature Range High: +155°C; Digikey Description: RES SMD 4.7 OHM 1% 1/4W 0805; RoHS: TRUE; Ipc Land Pattern Name: RESC200125X50; Category: Res; Automotive: Yes; Device Class L2: Resistors; ComponentLink2Description: Datasheet; Device Class L1: Passive Components; Temperature Range Low: -55°C; Lead Free: Yes; Footprint Url: http://www.yageo.com/exep/pages/download/literatures/PYu-R_Mount_10.pdf; Octopart: https://octopart.com/sr0805fr-7w4r7l-yageo-71414350; Height: 0.6mm; Composition: Thick Film; Device Class L3: Chip SMD Resistors; Series: SR; ComponentLink2URL: http://www.yageo.com/documents/recent/PYu-SR_D_F%20tol_RoHS_L_3.pdf; Package: SR0805; Temperature: -55°C to +155°C; Supplier: Farnell; Supplier Part Number: RQ73C2A75KBTD; Stock: 3515; Case/Package: 0805; China RoHS: Compliant; Length: 2mm; Lifecycle Status: Production; Max Operating Temperature: 155°C; Min Operating Temperature: -55°C; Mounting Technology: Surface Mount; Number of Terminals: 2; Operating Supply Voltage: 100V; Ratings: AEC-Q200; REACH SVHC: Yes; Width: 1.25mm; Working Voltage: 100V; ComponentLink1URL: https://datasheet.octopart.com:443/RQ73C2A75KBTD-TE-Connectivity-datasheet-179163842.pdf?src-supplier=IHS; ComponentLink1Description: https://datasheet.octopart.com:443/RQ73C2A75KBTD-TE-Connectivity-datasheet-179163842.pdf?src-supplier=IHS; ComponentLink3URL: https://datasheet.octopart.com:443/RQ73C2A75KBTD-TE-Connectivity-datasheet-141404639.pdf?src-supplier=Upverter; ComponentLink3Description: https://datasheet.octopart.com:443/RQ73C2A75KBTD-TE-Connectivity-datasheet-141404639.pdf?src-supplier=Upverter; ComponentLink4URL: https://datasheet.octopart.com:443/RQ73C2A75KBTD-TE-Connectivity-datasheet-129104565.pdf?src-supplier=Electro+Sonic; ComponentLink4Description: https://datasheet.octopart.com:443/RQ73C2A75KBTD-TE-Connectivity-datasheet-129104565.pdf?src-supplier=Electro+Sonic; ComponentLink5URL: https://sigma.octopart.com:443/129121914/technical_drawing/TE-Connectivity-RQ73C2A75KBTD.pdf?src-supplier=TE+Connectivity; ComponentLink5Description: https://sigma.octopart.com:443/129121914/technical_drawing/TE-Connectivity-RQ73C2A75KBTD.pdf?src-supplier=TE+Connectivity; ComponentLink6URL: https://datasheet.octopart.com:443/7-2176381-6-TE-Connectivity-datasheet-181572785.pdf?src-supplier=Sager+Electronics; ComponentLink6Description: https://datasheet.octopart.com:443/7-2176381-6-TE-Connectivity-datasheet-181572785.pdf?src-supplier=Sager+Electronics
R36 R61 = ERA-3VEB6341V: Fixed Resistor, Thin Film, 0.125W, 6340ohm, 100V, 0.1% +/-Tol, 25ppm/Cel, Surface Mount, 0603; Manufacturer_Name: Yageo Group; Manufacturer_Part_Number: SR0603FR-7T10KL; Manufacturer Lifecycle Status: ACTIVE; Part Series: Thin Film Chip Resistors, High Stability and Reliability Type; Power Rating: 250mW; Value: 10kΩ; Temperature Coefficient: 100ppm/°C; Tolerance: 1%; Voltage Rating: 75V; Working Voltage: 150V; Datasheet Link: https://mouser.componentsearchengine.com/Datasheets/1/SR0603FR-7T10KL.pdf; Height: 0.55mm; Mouser Part Number: 603-SR0603FR-7T10KL; Mouser Price/Stock: https://www.mouser.co.uk/ProductDetail/YAGEO/SR0603FR-7T10KL?qs=pfd5qewlna6IurLw3u3uRA%3D%3D; Arrow Part Number: SR0603FR-7T10KL; Arrow Price/Stock: https://www.arrow.com/en/products/sr0603fr-7t10kl/yageo; Supplier: DigiKey; Supplier Part Number: YAG5823CT-ND; Manufacturer: Yageo Group; Manufacturer Part Number: SR0603FR-7T10KL; RoHS: Compliant; Category: Chip SMD Resistors; Pricing: 1=0,67, 10=0,399, 25=0,3376, 50=0,3022, 100=0,2744, 250=0,24612, 500=0,22976, 1000=0,21675 (USD); Case/Package: 0603; China RoHS: Non-Compliant; Composition: Thick Film; Country of Origin: Mainland China, Taiwan; Export Control Classification Number (ECCN) Code: EAR99; Harmonized Tariff Schedule (HTS) Code: 8533.21.00.30; Introduction Date: 2017-10-02; Length: 1.6mm; Lifecycle Status: Production; Max Operating Temperature: 155°C; Min Operating Temperature: -55°C; Mounting Technology: Surface Mount; Number of Terminals: 2; Packaging: Tape & Reel; Ratings: AEC-Q200; REACH SVHC: Yes; Width: 800µm; ComponentLink1URL: https://datasheet.octopart.com:443/SR0603FR-7T10KL-Yageo-datasheet-176402240.pdf?src-supplier=Farnell; ComponentLink1Description: https://datasheet.octopart.com:443/SR0603FR-7T10KL-Yageo-datasheet-176402240.pdf?src-supplier=Farnell; ComponentLink2URL: https://datasheet.octopart.com:443/SR0603FR-7T10KL-Yageo-datasheet-119732217.pdf?src-supplier=Upverter; ComponentLink2Description: https://datasheet.octopart.com:443/SR0603FR-7T10KL-Yageo-datasheet-119732217.pdf?src-supplier=Upverter; ComponentLink3URL: https://datasheet.octopart.com:443/SR0603FR-7T10KL-Yageo-Group-datasheet-184785656.pdf?src-supplier=Future+Electronics; ComponentLink3Description: https://datasheet.octopart.com:443/SR0603FR-7T10KL-Yageo-Group-datasheet-184785656.pdf?src-supplier=Future+Electronics; ComponentLink4URL: https://datasheet.octopart.com:443/SR0603FR-7T10KL-Yageo-datasheet-155675517.pdf?src-supplier=Future+Electronics; ComponentLink4Description: https://datasheet.octopart.com:443/SR0603FR-7T10KL-Yageo-datasheet-155675517.pdf?src-supplier=Future+Electronics; ComponentLink5URL: https://datasheet.octopart.com:443/SR0603FR-7T10KL-Yageo-datasheet-137701088.pdf?src-supplier=Future+Electronics; ComponentLink5Description: https://datasheet.octopart.com:443/SR0603FR-7T10KL-Yageo-datasheet-137701088.pdf?src-supplier=Future+Electronics; ComponentLink6URL: https://datasheet.octopart.com/SR0603FR-7T10KL-Yageo-datasheet-11047080.pdf; ComponentLink6Description: https://datasheet.octopart.com/SR0603FR-7T10KL-Yageo-datasheet-11047080.pdf; ComponentLink7URL: http://sigma.octopart.com:80/conflict_mineral_statement/Yageo-company-3.pdf?src-supplier=Compliance+Statements; ComponentLink7Description: http://sigma.octopart.com:80/conflict_mineral_statement/Yageo-company-3.pdf?src-supplier=Compliance+Statements; ComponentLink8URL: http://sigma.octopart.com:80/rohs_statement/Yageo-company-2.pdf?src-supplier=Compliance+Statements; ComponentLink8Description: http://sigma.octopart.com:80/rohs_statement/Yageo-company-2.pdf?src-supplier=Compliance+Statements; Stock: 5000; ComponentLink9URL: https://datasheet.octopart.com:443/SR0603FR-7T4R7L-Yageo-datasheet-176402240.pdf?src-supplier=Farnell; ComponentLink9Description: https://datasheet.octopart.com:443/SR0603FR-7T4R7L-Yageo-datasheet-176402240.pdf?src-supplier=Farnell; ComponentLink10URL: https://datasheet.octopart.com:443/SR0603FR-7T4R7L-Yageo-datasheet-119732217.pdf?src-supplier=Upverter; ComponentLink10Description: https://datasheet.octopart.com:443/SR0603FR-7T4R7L-Yageo-datasheet-119732217.pdf?src-supplier=Upverter; ComponentLink11URL: https://datasheet.octopart.com:443/SR0603FR-7T4R7L-Yageo-Group-datasheet-184785656.pdf?src-supplier=Future+Electronics; ComponentLink11Description: https://datasheet.octopart.com:443/SR0603FR-7T4R7L-Yageo-Group-datasheet-184785656.pdf?src-supplier=Future+Electronics; ComponentLink12URL: https://datasheet.octopart.com:443/SR0603FR-7T4R7L-Yageo-datasheet-155675517.pdf?src-supplier=Future+Electronics; ComponentLink12Description: https://datasheet.octopart.com:443/SR0603FR-7T4R7L-Yageo-datasheet-155675517.pdf?src-supplier=Future+Electronics; ComponentLink13URL: https://datasheet.octopart.com:443/SR0603FR-7T4R7L-Yageo-datasheet-137701088.pdf?src-supplier=Future+Electronics; ComponentLink13Description: https://datasheet.octopart.com:443/SR0603FR-7T4R7L-Yageo-datasheet-137701088.pdf?src-supplier=Future+Electronics; ComponentLink14URL: https://datasheet.octopart.com/SR0603FR-7T4R7L-Yageo-datasheet-11047080.pdf; ComponentLink14Description: https://datasheet.octopart.com/SR0603FR-7T4R7L-Yageo-datasheet-11047080.pdf; Schedule B: 8533210045, 8533210045|8533210045|8533210045|8533210045|8533210045; ComponentLink15URL: https://datasheet.octopart.com:443/SR0603FR-7T100KL-Yageo-datasheet-176402240.pdf?src-supplier=element14+APAC; ComponentLink15Description: https://datasheet.octopart.com:443/SR0603FR-7T100KL-Yageo-datasheet-176402240.pdf?src-supplier=element14+APAC; ComponentLink16URL: https://datasheet.octopart.com:443/SR0603FR-7T100KL-Yageo-datasheet-119732217.pdf?src-supplier=Upverter; ComponentLink16Description: https://datasheet.octopart.com:443/SR0603FR-7T100KL-Yageo-datasheet-119732217.pdf?src-supplier=Upverter; ComponentLink17URL: https://datasheet.octopart.com:443/SR0603FR-7T100KL-Yageo-Group-datasheet-184785656.pdf?src-supplier=Future+Electronics; ComponentLink17Description: https://datasheet.octopart.com:443/SR0603FR-7T100KL-Yageo-Group-datasheet-184785656.pdf?src-supplier=Future+Electronics; ComponentLink18URL: https://datasheet.octopart.com:443/SR0603FR-7T100KL-Yageo-datasheet-155675517.pdf?src-supplier=Future+Electronics; ComponentLink18Description: https://datasheet.octopart.com:443/SR0603FR-7T100KL-Yageo-datasheet-155675517.pdf?src-supplier=Future+Electronics; ComponentLink19URL: https://datasheet.octopart.com:443/SR0603FR-7T100KL-Yageo-datasheet-137701088.pdf?src-supplier=Future+Electronics; ComponentLink19Description: https://datasheet.octopart.com:443/SR0603FR-7T100KL-Yageo-datasheet-137701088.pdf?src-supplier=Future+Electronics; ComponentLink20URL: https://datasheet.octopart.com/SR0603FR-7T100KL-Yageo-datasheet-11047080.pdf; ComponentLink20Description: https://datasheet.octopart.com/SR0603FR-7T100KL-Yageo-datasheet-11047080.pdf; Max Voltage Rating (DC): 100V; ComponentLink21URL: https://datasheet.octopart.com:443/RS73F1JTTD2001B-KOA-Speer-datasheet-182143723.pdf?src-supplier=IHS; ComponentLink21Description: https://datasheet.octopart.com:443/RS73F1JTTD2001B-KOA-Speer-datasheet-182143723.pdf?src-supplier=IHS; ComponentLink22URL: https://datasheet.octopart.com:443/RS73F1JTTD2001B-KOA-Speer-datasheet-141350738.pdf?src-supplier=KOA+Speer+SCT; ComponentLink22Description: https://datasheet.octopart.com:443/RS73F1JTTD2001B-KOA-Speer-datasheet-141350738.pdf?src-supplier=KOA+Speer+SCT; ComponentLink23URL: https://sigma.octopart.com:443/141350679/technical_drawing/KOA-Speer-RS73F1JTTD2001B.pdf?src-supplier=KOA+Speer+SCT; ComponentLink23Description: https://sigma.octopart.com:443/141350679/technical_drawing/KOA-Speer-RS73F1JTTD2001B.pdf?src-supplier=KOA+Speer+SCT; ComponentLink24URL: http://sigma.octopart.com:80/rohs_statement/KOA-Speer-company-17.pdf?src-supplier=Compliance+Statements; ComponentLink24Description: http://sigma.octopart.com:80/rohs_statement/KOA-Speer-company-17.pdf?src-supplier=Compliance+Statements; ComponentLink25URL: https://datasheet.octopart.com:443/ERA3VEB6341V-Panasonic-datasheet-150570798.pdf?src-supplier=Panasonic; ComponentLink25Description: https://datasheet.octopart.com:443/ERA3VEB6341V-Panasonic-datasheet-150570798.pdf?src-supplier=Panasonic; ComponentLink26URL: https://sigma.octopart.com:443/150570796/technical_drawing/Panasonic-ERA3VEB6341V.pdf?src-supplier=Panasonic+SCT; ComponentLink26Description: https://sigma.octopart.com:443/150570796/technical_drawing/Panasonic-ERA3VEB6341V.pdf?src-supplier=Panasonic+SCT
R44-R46 = ERJ-H3EF2201V: Fixed Resistor, Metal Glaze/thick Film, 0.125W, 2200ohm, 75V, 1% +/-Tol, 100ppm/Cel, Surface Mount, 0603; Manufacturer_Name: Yageo Group; Manufacturer_Part_Number: SR0603FR-7T10KL; Manufacturer Lifecycle Status: ACTIVE; Part Series: High Temperature Chip Resistors; Power Rating: 250mW; Value: 10kΩ; Temperature Coefficient: 100ppm/°C; Working Voltage: 150V; Max Voltage Rating (DC): 100V; Datasheet Link: https://mouser.componentsearchengine.com/Datasheets/1/SR0603FR-7T10KL.pdf; Height: 0.55mm; Mouser Part Number: 603-SR0603FR-7T10KL; Mouser Price/Stock: https://www.mouser.co.uk/ProductDetail/YAGEO/SR0603FR-7T10KL?qs=pfd5qewlna6IurLw3u3uRA%3D%3D; Arrow Part Number: SR0603FR-7T10KL; Arrow Price/Stock: https://www.arrow.com/en/products/sr0603fr-7t10kl/yageo; Supplier: DigiKey; Supplier Part Number: YAG5823CT-ND; Manufacturer: Yageo Group; Manufacturer Part Number: SR0603FR-7T10KL; RoHS: Compliant; Category: Chip SMD Resistors; Pricing: 1=0,67, 10=0,399, 25=0,3376, 50=0,3022, 100=0,2744, 250=0,24612, 500=0,22976, 1000=0,21675 (USD); Case/Package: 0603; China RoHS: Non-Compliant; Composition: Thick Film; Country of Origin: Mainland China, Taiwan; Export Control Classification Number (ECCN) Code: EAR99; Harmonized Tariff Schedule (HTS) Code: 8533.21.00.30; Introduction Date: 2017-10-02; Length: 1.6mm; Lifecycle Status: Production; Max Operating Temperature: 155°C; Min Operating Temperature: -55°C; Mounting Technology: Surface Mount; Number of Terminals: 2; Packaging: Tape & Reel; Ratings: AEC-Q200; REACH SVHC: Yes; Tolerance: 1%; Voltage Rating: 75V; Width: 800µm; ComponentLink1URL: https://datasheet.octopart.com:443/SR0603FR-7T10KL-Yageo-datasheet-176402240.pdf?src-supplier=Farnell; ComponentLink1Description: https://datasheet.octopart.com:443/SR0603FR-7T10KL-Yageo-datasheet-176402240.pdf?src-supplier=Farnell; ComponentLink2URL: https://datasheet.octopart.com:443/SR0603FR-7T10KL-Yageo-datasheet-119732217.pdf?src-supplier=Upverter; ComponentLink2Description: https://datasheet.octopart.com:443/SR0603FR-7T10KL-Yageo-datasheet-119732217.pdf?src-supplier=Upverter; ComponentLink3URL: https://datasheet.octopart.com:443/SR0603FR-7T10KL-Yageo-Group-datasheet-184785656.pdf?src-supplier=Future+Electronics; ComponentLink3Description: https://datasheet.octopart.com:443/SR0603FR-7T10KL-Yageo-Group-datasheet-184785656.pdf?src-supplier=Future+Electronics; ComponentLink4URL: https://datasheet.octopart.com:443/SR0603FR-7T10KL-Yageo-datasheet-155675517.pdf?src-supplier=Future+Electronics; ComponentLink4Description: https://datasheet.octopart.com:443/SR0603FR-7T10KL-Yageo-datasheet-155675517.pdf?src-supplier=Future+Electronics; ComponentLink5URL: https://datasheet.octopart.com:443/SR0603FR-7T10KL-Yageo-datasheet-137701088.pdf?src-supplier=Future+Electronics; ComponentLink5Description: https://datasheet.octopart.com:443/SR0603FR-7T10KL-Yageo-datasheet-137701088.pdf?src-supplier=Future+Electronics; ComponentLink6URL: https://datasheet.octopart.com/SR0603FR-7T10KL-Yageo-datasheet-11047080.pdf; ComponentLink6Description: https://datasheet.octopart.com/SR0603FR-7T10KL-Yageo-datasheet-11047080.pdf; ComponentLink7URL: http://sigma.octopart.com:80/conflict_mineral_statement/Yageo-company-3.pdf?src-supplier=Compliance+Statements; ComponentLink7Description: http://sigma.octopart.com:80/conflict_mineral_statement/Yageo-company-3.pdf?src-supplier=Compliance+Statements; ComponentLink8URL: http://sigma.octopart.com:80/rohs_statement/Yageo-company-2.pdf?src-supplier=Compliance+Statements; ComponentLink8Description: http://sigma.octopart.com:80/rohs_statement/Yageo-company-2.pdf?src-supplier=Compliance+Statements; Stock: 5000; ComponentLink9URL: https://datasheet.octopart.com:443/SR0603FR-7T4R7L-Yageo-datasheet-176402240.pdf?src-supplier=Farnell; ComponentLink9Description: https://datasheet.octopart.com:443/SR0603FR-7T4R7L-Yageo-datasheet-176402240.pdf?src-supplier=Farnell; ComponentLink10URL: https://datasheet.octopart.com:443/SR0603FR-7T4R7L-Yageo-datasheet-119732217.pdf?src-supplier=Upverter; ComponentLink10Description: https://datasheet.octopart.com:443/SR0603FR-7T4R7L-Yageo-datasheet-119732217.pdf?src-supplier=Upverter; ComponentLink11URL: https://datasheet.octopart.com:443/SR0603FR-7T4R7L-Yageo-Group-datasheet-184785656.pdf?src-supplier=Future+Electronics; ComponentLink11Description: https://datasheet.octopart.com:443/SR0603FR-7T4R7L-Yageo-Group-datasheet-184785656.pdf?src-supplier=Future+Electronics; ComponentLink12URL: https://datasheet.octopart.com:443/SR0603FR-7T4R7L-Yageo-datasheet-155675517.pdf?src-supplier=Future+Electronics; ComponentLink12Description: https://datasheet.octopart.com:443/SR0603FR-7T4R7L-Yageo-datasheet-155675517.pdf?src-supplier=Future+Electronics; ComponentLink13URL: https://datasheet.octopart.com:443/SR0603FR-7T4R7L-Yageo-datasheet-137701088.pdf?src-supplier=Future+Electronics; ComponentLink13Description: https://datasheet.octopart.com:443/SR0603FR-7T4R7L-Yageo-datasheet-137701088.pdf?src-supplier=Future+Electronics; ComponentLink14URL: https://datasheet.octopart.com/SR0603FR-7T4R7L-Yageo-datasheet-11047080.pdf; ComponentLink14Description: https://datasheet.octopart.com/SR0603FR-7T4R7L-Yageo-datasheet-11047080.pdf; Schedule B: 8533210045, 8533210045|8533210045|8533210045|8533210045|8533210045; ComponentLink15URL: https://datasheet.octopart.com:443/SR0603FR-7T100KL-Yageo-datasheet-176402240.pdf?src-supplier=element14+APAC; ComponentLink15Description: https://datasheet.octopart.com:443/SR0603FR-7T100KL-Yageo-datasheet-176402240.pdf?src-supplier=element14+APAC; ComponentLink16URL: https://datasheet.octopart.com:443/SR0603FR-7T100KL-Yageo-datasheet-119732217.pdf?src-supplier=Upverter; ComponentLink16Description: https://datasheet.octopart.com:443/SR0603FR-7T100KL-Yageo-datasheet-119732217.pdf?src-supplier=Upverter; ComponentLink17URL: https://datasheet.octopart.com:443/SR0603FR-7T100KL-Yageo-Group-datasheet-184785656.pdf?src-supplier=Future+Electronics; ComponentLink17Description: https://datasheet.octopart.com:443/SR0603FR-7T100KL-Yageo-Group-datasheet-184785656.pdf?src-supplier=Future+Electronics; ComponentLink18URL: https://datasheet.octopart.com:443/SR0603FR-7T100KL-Yageo-datasheet-155675517.pdf?src-supplier=Future+Electronics; ComponentLink18Description: https://datasheet.octopart.com:443/SR0603FR-7T100KL-Yageo-datasheet-155675517.pdf?src-supplier=Future+Electronics; ComponentLink19URL: https://datasheet.octopart.com:443/SR0603FR-7T100KL-Yageo-datasheet-137701088.pdf?src-supplier=Future+Electronics; ComponentLink19Description: https://datasheet.octopart.com:443/SR0603FR-7T100KL-Yageo-datasheet-137701088.pdf?src-supplier=Future+Electronics; ComponentLink20URL: https://datasheet.octopart.com/SR0603FR-7T100KL-Yageo-datasheet-11047080.pdf; ComponentLink20Description: https://datasheet.octopart.com/SR0603FR-7T100KL-Yageo-datasheet-11047080.pdf; ComponentLink21URL: https://datasheet.octopart.com:443/RS73F1JTTD2001B-KOA-Speer-datasheet-182143723.pdf?src-supplier=IHS; ComponentLink21Description: https://datasheet.octopart.com:443/RS73F1JTTD2001B-KOA-Speer-datasheet-182143723.pdf?src-supplier=IHS; ComponentLink22URL: https://datasheet.octopart.com:443/RS73F1JTTD2001B-KOA-Speer-datasheet-141350738.pdf?src-supplier=KOA+Speer+SCT; ComponentLink22Description: https://datasheet.octopart.com:443/RS73F1JTTD2001B-KOA-Speer-datasheet-141350738.pdf?src-supplier=KOA+Speer+SCT; ComponentLink23URL: https://sigma.octopart.com:443/141350679/technical_drawing/KOA-Speer-RS73F1JTTD2001B.pdf?src-supplier=KOA+Speer+SCT; ComponentLink23Description: https://sigma.octopart.com:443/141350679/technical_drawing/KOA-Speer-RS73F1JTTD2001B.pdf?src-supplier=KOA+Speer+SCT; ComponentLink24URL: http://sigma.octopart.com:80/rohs_statement/KOA-Speer-company-17.pdf?src-supplier=Compliance+Statements; ComponentLink24Description: http://sigma.octopart.com:80/rohs_statement/KOA-Speer-company-17.pdf?src-supplier=Compliance+Statements; ComponentLink25URL: https://datasheet.octopart.com:443/ERJH3EF2201V-Panasonic-datasheet-182147299.pdf?src-supplier=IHS; ComponentLink25Description: https://datasheet.octopart.com:443/ERJH3EF2201V-Panasonic-datasheet-182147299.pdf?src-supplier=IHS; ComponentLink26URL: https://datasheet.octopart.com:443/ERJH3EF2201V-Panasonic-datasheet-150823776.pdf?src-supplier=Panasonic; ComponentLink26Description: https://datasheet.octopart.com:443/ERJH3EF2201V-Panasonic-datasheet-150823776.pdf?src-supplier=Panasonic; ComponentLink27URL: https://datasheet.octopart.com:443/ERJH3EF2201V-Panasonic-datasheet-165581513.pdf?src-supplier=TME; ComponentLink27Description: https://datasheet.octopart.com:443/ERJH3EF2201V-Panasonic-datasheet-165581513.pdf?src-supplier=TME